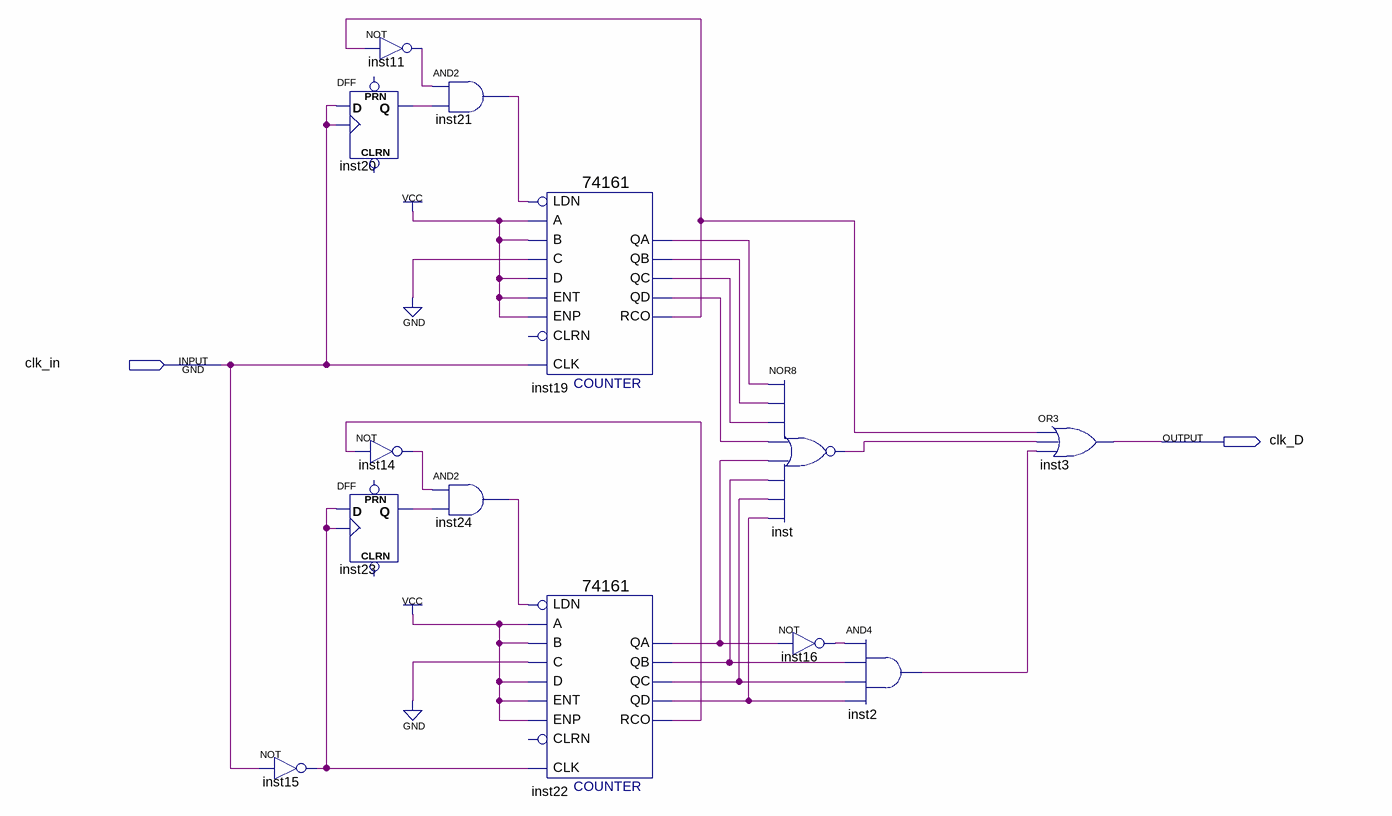
[diagram p0: schematic sheet]
// Quartus schematic block_2.bdf as structural Verilog: 13 symbols, 2 pins
module block_2 (
  input  clk_in,
  output clk_D
);

  wire inst2_out, inst11_out, inst14_out, inst15_out, inst16_out, inst19_qa, inst19_qb, inst19_qc, inst19_qd,
       inst19_rco, inst20_q, inst21_out, inst22_qa, inst22_qb, inst22_qc, inst22_qd, inst22_rco, inst23_q,
       inst24_out, inst_out;

  not inst15 (inst15_out, clk_in);
  not inst11 (inst11_out, inst19_rco);
  DFF inst20 (.CLK(clk_in), .D(clk_in), .Q(inst20_q));  // open: CLRN, PRN
  not inst14 (inst14_out, inst22_rco);
  DFF inst23 (.CLK(inst15_out), .D(inst15_out), .Q(inst23_q));  // open: CLRN, PRN
  and inst21 (inst21_out, inst11_out, inst20_q);
  and inst24 (inst24_out, inst14_out, inst23_q);
  \74161  inst19 (
    .CLK(clk_in), .ENP(1'b1), .LDN(inst21_out), .A(1'b1), .D(1'b1), .ENT(1'b1), .B(1'b1), .C(1'b0),
    .QD(inst19_qd), .QC(inst19_qc), .QB(inst19_qb), .QA(inst19_qa), .RCO(inst19_rco));  // open: CLRN
  \74161  inst22 (
    .CLK(inst15_out), .ENP(1'b1), .LDN(inst24_out), .A(1'b1), .D(1'b1), .ENT(1'b1), .B(1'b1), .C(1'b0),
    .QD(inst22_qd), .QC(inst22_qc), .QB(inst22_qb), .QA(inst22_qa), .RCO(inst22_rco));  // open: CLRN
  nor inst (inst_out, inst19_qa, inst19_qb, inst19_qc, inst19_qd, inst22_qa, inst22_qb, inst22_qc, inst22_qd);
  not inst16 (inst16_out, inst22_qa);
  and inst2 (inst2_out, inst16_out, inst22_qb, inst22_qc, inst22_qd);
  or inst3 (clk_D, inst19_rco, inst_out, inst2_out);
endmodule
